# Altium schematic sheet IO.SchDoc: Wi-Fi module, relays, and display
size A3; SheetNumber: Sheet 3 of 3
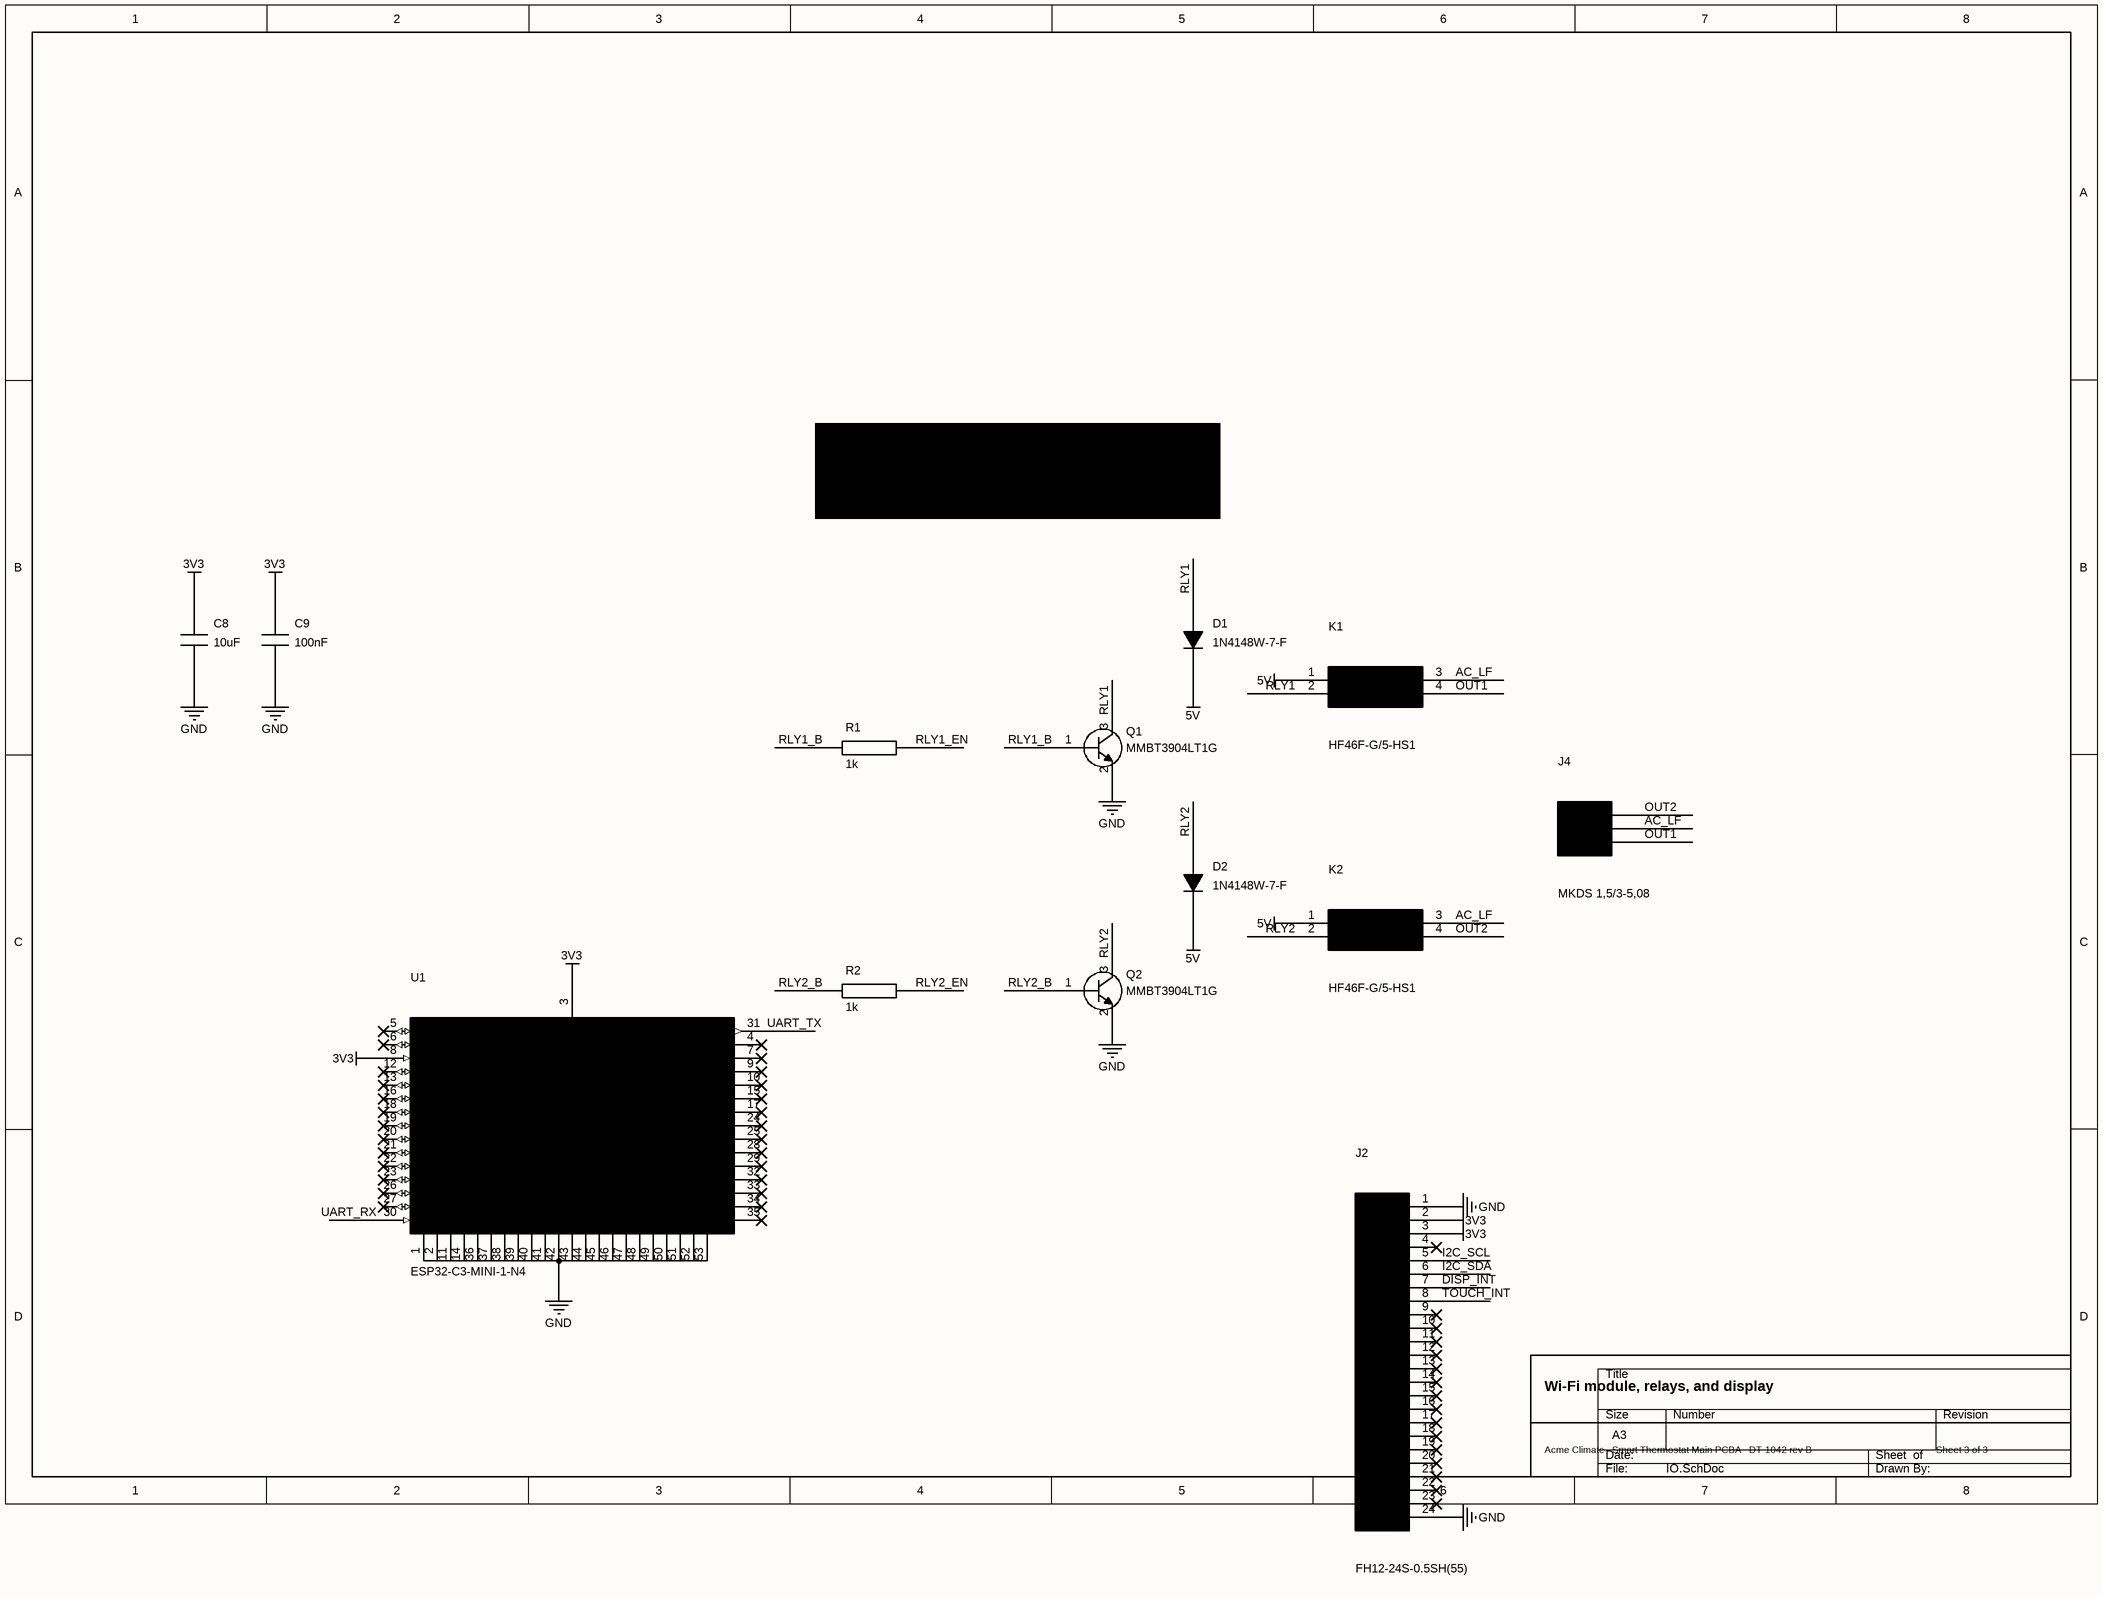
[diagram p0: IO.SchDoc]

## Parts
C8  10uF
C9  100nF
D1  1N4148W-7-F
D2  1N4148W-7-F
J2  FH12-24S-0.5SH(55)
J4  MKDS 1,5/3-5,08
K1  HF46F-G/5-HS1
K2  HF46F-G/5-HS1
Q1  MMBT3904LT1G
Q2  MMBT3904LT1G
R1  1k
R2  1k
U1  ESP32-C3-MINI-1-N4

## Nets
3V3: C8.1 C9.1 J2.2 J2.3 U1.3(3V3) U1.8(EN)
5V: D1.1(K) D2.1(K) K1.1(A1) K2.1(A1)
GND: C8.2 C9.2 J2.1 J2.24 Q1.2(E) Q2.2(E) U1.1(GND) U1.2(GND) U1.11(GND) U1.14(GND) U1.36(GND) U1.37(GND) U1.38(GND) U1.39(GND) U1.40(GND) U1.41(GND) U1.42(GND) U1.43(GND) U1.44(GND) U1.45(GND) U1.46(GND) U1.47(GND) U1.48(GND) U1.49(GND) U1.50(GND) U1.51(GND) U1.52(GND) U1.53(GND)
AC_LF: J4.2 K1.3(COM) K2.3(COM)
DISP_INT: J2.7
I2C_SCL: J2.5
I2C_SDA: J2.6
OUT1: J4.3 K1.4(NO)
OUT2: J4.1 K2.4(NO)
RLY1: D1.2(A) K1.2(A2) Q1.3(C)
RLY1_B: Q1.1(B) R1.1
RLY1_EN: R1.2
RLY2: D2.2(A) K2.2(A2) Q2.3(C)
RLY2_B: Q2.1(B) R2.1
RLY2_EN: R2.2
TOUCH_INT: J2.8
UART_RX: U1.30(RXD0)
UART_TX: U1.31(TXD0)

Not connected (* = marked no-connect by the designer): J2 4* 9* 10* 11* 12* 13* 14* 15* 16* 17* 18* 19* 20* 21* 22* 23*; U1 4(NC)* 5(IO2)* 6(IO3)* 7(NC)* 9(NC)* 10(NC)* 12(IO0)* 13(IO1)* 15(NC)* 16(IO10)* 17(NC)* 18(IO4)* 19(IO5)* 20(IO6)* 21(IO7)* 22(IO8)* 23(IO9)* 24(NC)* 25(NC)* 26(IO18)* 27(IO19)* 28(NC)* 29(NC)* 32(NC)* 33(NC)* 34(NC)* 35(NC)*

## Notes on the sheet
- Relay coils run from 5 V; the MCU drives each through an NPN, with a flyback diode.
- Acme Climate · Smart Thermostat Main PCBA · DT-1042 rev B

## Library data of the parts
C8 = C: CAP CER 10UF 25V X5R 0805; Manufacturer Part Number: CL21A106KAYNNNE; Manufacturer: Samsung
C9 = C: CAP CER 0.1UF 16V X7R 0402; Manufacturer Part Number: GRM155R71C104KA88D; Manufacturer: Murata
D1 D2 = D: DIODE GEN PURP 100V 300MA SOD123; Manufacturer: Diodes Incorporated; Manufacturer Part Number: 1N4148W-7-F
J2 = FFC_24: CONN FFC BOTTOM 24POS 0.50MM R/A; Manufacturer: Hirose; Manufacturer Part Number: FH12-24S-0.5SH(55)
J4 = TerminalBlock_3: TERM BLK 3POS SIDE ENTRY 5.08MM PCB; Manufacturer Part Number: 1729131; Manufacturer: Phoenix Contact
K1 K2 = Relay_SPST: RELAY GEN PURPOSE SPST 5A 5V; Manufacturer: Hongfa; Manufacturer Part Number: HF46F-G/5-HS1
Q1 Q2 = Q_NPN_BEC: TRANS NPN 40V 0.2A SOT23; Manufacturer: onsemi; Manufacturer Part Number: MMBT3904LT1G
R1 R2 = R: RES SMD 1k 1% 1/16W 0402; Manufacturer Part Number: RC0402FR-071KL; Manufacturer: Yageo
U1 = ESP32-C3-MINI-1: RF TXRX MOD WIFI/BT SMD 4MB; Manufacturer: Espressif Systems; Manufacturer Part Number: ESP32-C3-MINI-1-N4